# Altium schematic sheet 70_DEBUG_BOOT.SchDoc
size 297 x 209 mm
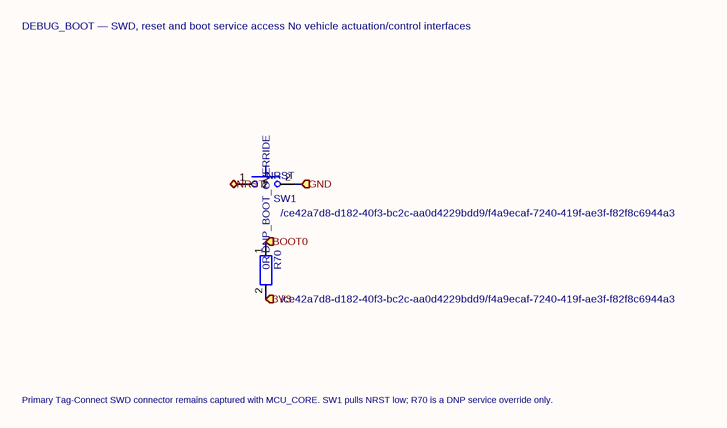
[diagram p0: 70_DEBUG_BOOT.SchDoc]

## Parts
R70  hierarchy_path: /ce42a7d8-d182-40f3-bc2c-aa0d4229bdd9/f4a9ecaf-7240-419f-ae3f-f82f8c6944a3  [R_0603_1608Metric]  (hidden comment: 0R DNP_BOOT_OVERRIDE)
SW1  hierarchy_path: /ce42a7d8-d182-40f3-bc2c-aa0d4229bdd9/f4a9ecaf-7240-419f-ae3f-f82f8c6944a3  [ESwitch_TL3301_GullWing_6x6]  (hidden comment: NRST)

## Ports
3V3 (in), BOOT0, GND, NRST (bidir)

## Nets
3V3: R70.2 ; port 3V3
BOOT0: R70.1 ; port BOOT0
GND: SW1.2 ; port GND
NRST: SW1.1 ; port NRST

## Notes on the sheet
- DEBUG_BOOT — SWD, reset and boot service access
  No vehicle actuation/control interfaces
- Primary Tag-Connect SWD connector remains captured with MCU_CORE.
  SW1 pulls NRST low; R70 is a DNP service override only.
- 1
- 2
- 3
- 4
- 5
- 6
- A
- B
- C
- D
- Title: EVT_SYS_CARRIER
- File: 70_DEBUG_BOOT.kicad_sch
- Sheet: /
- KiCad E.D.A.  kicad (5.1.4)-1
- Size: A4
- Date:
- Rev:
- Id: 1/1

## Library data of the parts
R70 = R: Value: 0R DNP_BOOT_OVERRIDE; Footprint: Resistor_SMD:R_0603_1608Metric
SW1 = SW_Push: Value: NRST; Footprint: SystemCarrier_Altium:ESwitch_TL3301_GullWing_6x6